# EasyEDA Pro project uno-glue-controller-single-fet-231125_backup-2025-11-30.epro

# Schematic arduino uno 24v shield v5 2025-10-22
Board Name: arduino uno 24v shield v5 2025-10-22; Create Date: 2025-11-23; Page Name: arduino shield v52025-10-22; Project Name: uno glue controller single fet 231125; Schematic Name: arduino uno 24v shield v5 2025-10-22; Update Date: 2025-11-23; Add into BOM: yes; Company: Your Company; Convert to PCB: yes; Date: 2021-08-25; Draw By: אור לב; REV: 1.0; Sheet: 1/1; spicePre: .
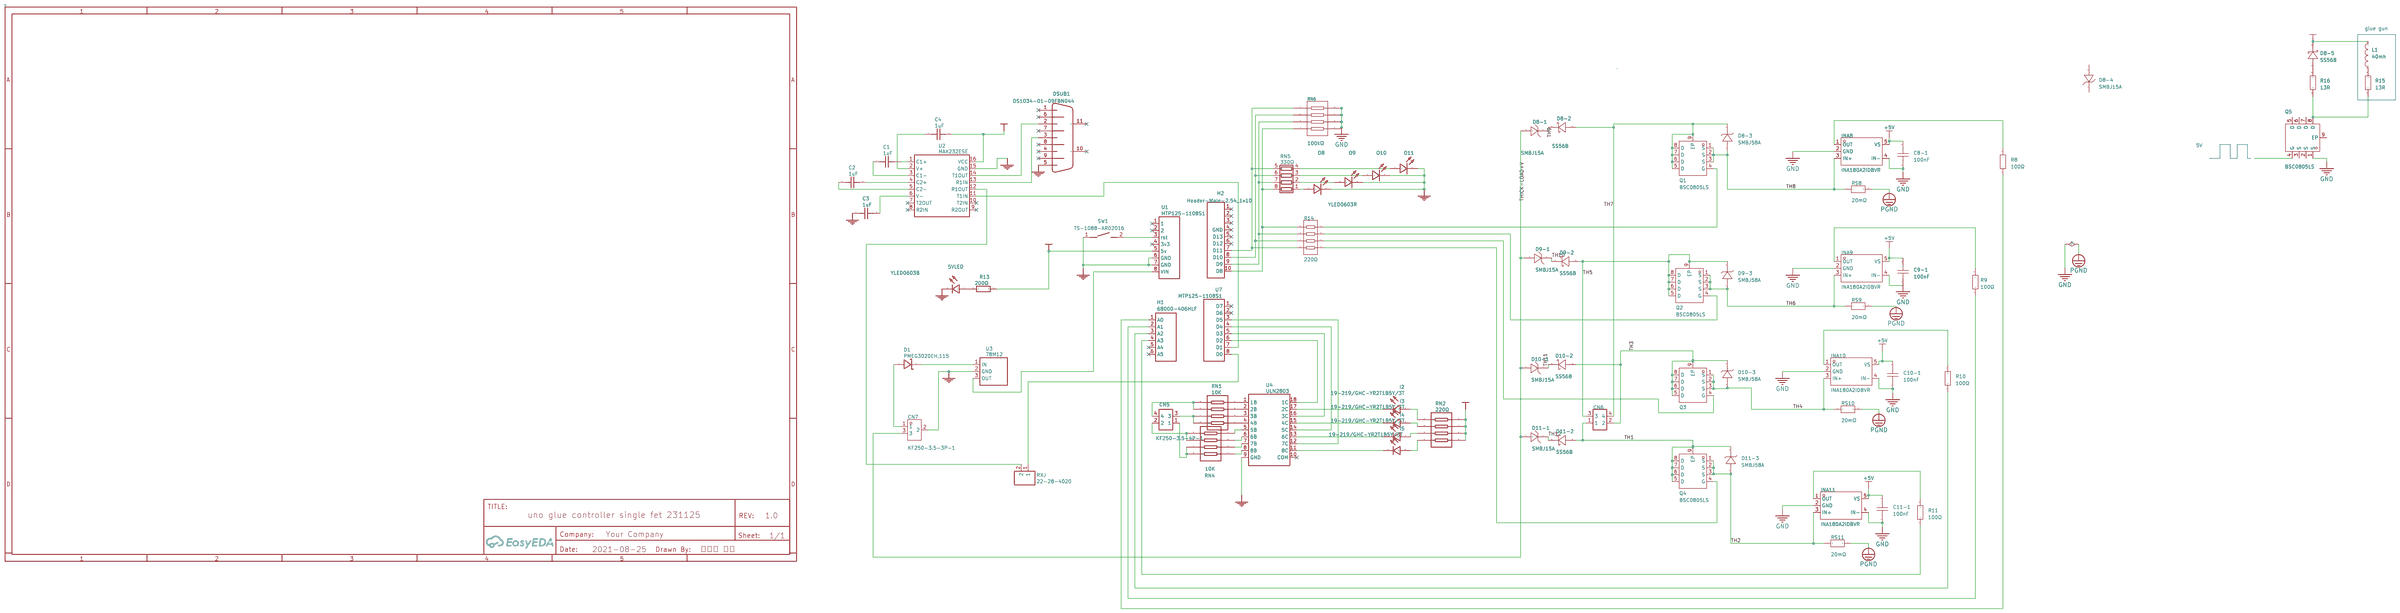
[diagram p0: schematic sheet]

## Parts
5VLED  YLED0603B  [LED0603-FD]
C1  1uF  [C0603]
C2  1uF  [C0603]
C3  1uF  [C0603]
C4  1uF  [C0603]
C8-1  100nF  [C0603]
C9-1  100nF  [C0603]
C10-1  100nF  [C0603]
C11-1  100nF  [C0603]
CN5  KF250-3.5-4P-1  [CONN-TH_4P-P3.50_KF250-3.5-4P-1]
CN6  KF250-3.5-4P-1  [CONN-TH_4P-P3.50_KF250-3.5-4P-1]
CN7  KF250-3.5-3P-1  [CONN-TH_3P-P3.50_KF250-3.5-3P-1]
D1  PMEG3020EH,115  [SOD-123FL_L2.6-W1.6-LS3.4-R-FD]
D8-1  SMBJ15A  [SMB_L4.6-W3.6-LS5.3-RD]
D8-2  SS56B  [SMB_L4.6-W3.7-LS5.4-RD]
D8-3  SMBJ58A  [SMB_L4.6-W3.6-LS5.3-R-RD]
D8-4  SMBJ15A  [SMB_L4.6-W3.6-LS5.3-RD]
D8-5  SS56B  [SMB_L4.6-W3.7-LS5.4-RD]
D9-1  SMBJ15A  [SMB_L4.6-W3.6-LS5.3-RD]
D9-2  SS56B  [SMB_L4.6-W3.7-LS5.4-RD]
D9-3  SMBJ58A  [SMB_L4.6-W3.6-LS5.3-R-RD]
D10-1  SMBJ15A  [SMB_L4.6-W3.6-LS5.3-RD]
D10-2  SS56B  [SMB_L4.6-W3.7-LS5.4-RD]
D10-3  SMBJ58A  [SMB_L4.6-W3.6-LS5.3-R-RD]
D11-1  SMBJ15A  [SMB_L4.6-W3.6-LS5.3-RD]
D11-2  SS56B  [SMB_L4.6-W3.7-LS5.4-RD]
D11-3  SMBJ58A  [SMB_L4.6-W3.6-LS5.3-R-RD]
DSUB1  DS1034-01-09FBN044  [DSUB-TH_DS1034-01-09FBN044]
H1  68000-406HLF  [HDR-TH_6P-P2.54-V-M-1]
H2  Header-Male-2.54_1x10  [HDR-TH_10P-P2.54-V-M-1]
I2  19-219/GHC-YR2T1B5Y/3T  [LED-SMD_L1.6-W0.8_19-219-GHC-YR2T1B5Y-3T]
I3  19-219/GHC-YR2T1B5Y/3T  [LED-SMD_L1.6-W0.8_19-219-GHC-YR2T1B5Y-3T]
I4  19-219/GHC-YR2T1B5Y/3T  [LED-SMD_L1.6-W0.8_19-219-GHC-YR2T1B5Y-3T]
I5  19-219/GHC-YR2T1B5Y/3T  [LED-SMD_L1.6-W0.8_19-219-GHC-YR2T1B5Y-3T]
INA8  INA180A2IDBVR  [SOT-23-5_L3.0-W1.7-P0.95-LS2.8-BL]
INA9  INA180A2IDBVR  [SOT-23-5_L3.0-W1.7-P0.95-LS2.8-BL]
INA10  INA180A2IDBVR  [SOT-23-5_L3.0-W1.7-P0.95-LS2.8-BL]
INA11  INA180A2IDBVR  [SOT-23-5_L3.0-W1.7-P0.95-LS2.8-BL]
L1  40mh  [L0603]
O8  YLED0603R  [LED0603-FD]
O9  YLED0603R  [LED0603-FD]
O10  YLED0603R  [LED0603-FD]
O11  YLED0603R  [LED0603-FD]
Q1  BSC0805LS  [PG-TDSON-8_L5.2-W5.9-P1.27-LS6.2-BL-EP]
Q2  BSC0805LS  [PG-TDSON-8_L5.2-W5.9-P1.27-LS6.2-BL-EP]
Q3  BSC0805LS  [PG-TDSON-8_L5.2-W5.9-P1.27-LS6.2-BL-EP]
Q4  BSC0805LS  [PG-TDSON-8_L5.2-W5.9-P1.27-LS6.2-BL-EP]
Q5  BSC0805LS  [PG-TDSON-8_L5.2-W5.9-P1.27-LS6.2-BL-EP]
R8  100Ω  [R0603]
R9  100Ω  [R0603]
R10  100Ω  [R0603]
R11  100Ω  [R0603]
R13  200Ω  [R0603]
R14  220Ω  [RES-ARRAY-SMD_0402-8P-L2.0-W1.0-BL]
R15  13R  [R0603]
R16  13R  [R0603]
RN1  10K  [RES-ARRAY-SMD_0603-8P-L3.2-W1.6-BL]
RN2  220Ω  [RES-ARRAY-SMD_0603-8P-L3.2-W1.6-BL]
RN4  10K  [RES-ARRAY-SMD_0603-8P-L3.2-W1.6-BL]
RN5  330Ω  [RES-ARRAY-SMD_0402-8P-L2.0-W1.0-BL]
RN6  100kΩ  [RES-ARRAY-SMD_0402-8P-L2.0-W1.0-BL]
RS8  20mΩ  [R1206]
RS9  20mΩ  [R1206]
RS10  20mΩ  [R1206]
RS11  20mΩ  [R1206]
RXJ  22-28-4020  [HDR-TH_2P-P2.54-V-M-1]
SW1  TS-1088-AR02016  [SW-SMD_L4.0-W2.9-LS5.0]
U1  MTP125-1108S1  [HDR-TH_8P-P2.54-H-M]
U2  MAX232ESE  [SOIC-16_L9.9-W3.9-P1.27-LS6.0-BL]
U3  78M12  [TO-252-2_L6.6-W6.1-P4.57-LS9.9-TL-CW]
U4  ULN2803  [SOP-18_L11.4-W7.6-P1.27-LS10.6-BL]
U7  MTP125-1108S1  [HDR-TH_8P-P2.54-H-M]

## Library data of the parts
5VLED = YLED0603B: Emitted Color:Blue Forward Voltage (VF):2.6V~3.2V Forward Voltage (VF):2.6V~3.2V Power Dissipation:- Forward Current:30mA Dominant Wavelength:460nm~475nm Dominant Wavelength:460nm~475nm Peak Wavelength:- Viewing Angle:120° Operating Temperature:-40℃~+85℃; Supplier Part: C19171394; Manufacturer: YONGYUTAI(永裕泰); Supplier Footprint: 0603; JLCPCB Part Class: Extended Part; Datasheet: https://atta.szlcsc.com/upload/public/pdf/source/20231027/6134FF4BA718E32A802654BBC76F69A6.pdf; Supplier: LCSC; Emitted Color: Blue; Forward Voltage (VF): 2.6V~3.2V; Forward Current: 30mA; Dominant Wavelength: 460nm~475nm; Viewing Angle: 120°; Operating Temperature: -40℃~+85℃
C1-C4 = CL10A105KO8NNNC: Capacitance:1uF Tolerance:±10% Tolerance:±10% Voltage Rating:16V Temperature Coefficient:X5R; LCSC Part Name: 1uF ±10% 16V; Supplier Part: C1592; Manufacturer: SAMSUNG(三星); Supplier Footprint: 0603; JLCPCB Part Class: Extended Part; Datasheet: https://item.szlcsc.com/datasheet/CL10A105KO8NNNC/1944.html; Supplier: LCSC; Tolerance: ±10%; Voltage Rating: 16V; Temperature Coefficient: X5R
C8-1 C9-1 C10-1 C11-1 = CC0603KRX7R9BB104: Capacitance:100nF Tolerance:±10% Tolerance:±10% Voltage Rating:50V Temperature Coefficient:X7R; LCSC Part Name: 100nF ±10% 50V; Supplier Part: C14663; Manufacturer: YAGEO(国巨); Supplier Footprint: 0603; JLCPCB Part Class: Basic Part; Datasheet: https://item.szlcsc.com/datasheet/CC0603KRX7R9BB104/15331.html; Supplier: LCSC; Tolerance: ±10%; Voltage Rating: 50V; Temperature Coefficient: X7R
CN5 CN6 = KF250-3.5-4P-1: Pitch:3.5mm Mounting Type:- Number of Pins:4P Number of PINs Per Row:4 Current Rating:5A Voltage Rating (Max):400V Wire Gauge - AWG:18~22 Wire Gauge - mm2:0.75; LCSC Part Name: 3.5mm 每排P数:4; Supplier Part: C475156; Manufacturer: KEFA(科发); Supplier Footprint: 插件,P=3.5mm; JLCPCB Part Class: Extended Part; Datasheet: https://item.szlcsc.com/datasheet/KF250-3.5-4P-1/481652.html; Supplier: LCSC; Pitch: 3.5mm; Number of Pins: 4P; Number of PINs Per Row: 4; Current Rating: 5A; Voltage Rating (Max): 400V; Wire Gauge - AWG: 18~22; Wire Gauge - mm2: 0.75
CN7 = KF250-3.5-3P-1: Pitch:3.5mm Mounting Type:- Number of Pins:3P Number of PINs Per Row:3 Current Rating:5A Voltage Rating (Max):400V Wire Gauge - AWG:18~22 Wire Gauge - mm2:0.75; LCSC Part Name: 3.5mm 每排P数:3; Supplier Part: C475155; Manufacturer: KEFA(科发); Supplier Footprint: 插件,P=3.5mm; JLCPCB Part Class: Extended Part; Datasheet: https://item.szlcsc.com/datasheet/KF250-3.5-3P-1/481651.html; Supplier: LCSC; Pitch: 3.5mm; Number of Pins: 3P; Number of PINs Per Row: 3; Current Rating: 5A; Voltage Rating (Max): 400V; Wire Gauge - AWG: 18~22; Wire Gauge - mm2: 0.75
D1 = PMEG3020EH,115: Supplier: LCSC; Supplier Part: C167645; Manufacturer: Nexperia; JLCPCB Part Class: Extended Part; Contributor: LCSC; spicePre: D
D8-1 D8-4 D9-1 D10-1 D11-1 = SMBJ15A_C908796: Polarity:Unidirectional Reverse Stand-Off Voltage (Vrwm):15V Clamping Voltage:24.4V Peak Pulse Current (Ipp):24A Peak Pulse Power Dissipation (Ppp):600W Voltage - Breakdown:16.7V Reverse Leakage Current (Ir):5uA Operating Temperature:-55℃~+150℃@(Tj) Opera; LCSC Part Name: 单向TVS 15V截止 24A峰值脉冲; Supplier Part: C908796; Manufacturer: GOODWORK(固得沃克); Supplier Footprint: DO-214AA(SMB); JLCPCB Part Class: Extended Part; Datasheet: https://item.szlcsc.com/datasheet/SMBJ15A/975548.html; Supplier: LCSC; Polarity: Unidirectional; Reverse Stand-Off Voltage (Vrwm): 15V; Clamping Voltage: 24.4V; Peak Pulse Current (Ipp): 24A; Peak Pulse Power Dissipation (Ppp): 600W; Voltage - Breakdown: 16.7V; Reverse Leakage Current (Ir): 5uA; Operating Temperature: -55℃~+150℃@(Tj); Type: TVS
D8-2 D8-5 D9-2 D10-2 D11-2 = SS56B_C5343335: Diode Configuration:Independent Voltage - Forward(Vf@If):700mV@5A Voltage - DC Reverse(Vr):60V Current - Rectified:5A; LCSC Part Name: 电压:60V 电流:5A; Supplier Part: C5343335; Manufacturer: MSKSEMI(美森科); Supplier Footprint: SMB; JLCPCB Part Class: Extended Part; Datasheet: https://item.szlcsc.com/datasheet/SS56B/6120058.html; Supplier: LCSC; Diode Configuration: Independent; Voltage - Forward(Vf@If): 700mV@5A; Voltage - DC Reverse(Vr): 60V; Current - Rectified: 5A
D8-3 D9-3 D10-3 D11-3 = SMBJ58A_C41376102: Polarity:Unidirectional Reverse Stand-Off Voltage (Vrwm):58V Clamping Voltage:93.6V Peak Pulse Current (Ipp):6.41A Peak Pulse Power Dissipation (Ppp):600W Voltage - Breakdown:71.2V Reverse Leakage Current (Ir):5uA Number of Channels:1.0 Operating Temperat; LCSC Part Name: 单向TVS 58V截止 峰值浪涌电流：6.41A; Supplier Part: C41376102; Manufacturer: R+O(宏嘉诚); Supplier Footprint: DO-214AA(SMB); JLCPCB Part Class: Extended Part; Datasheet: https://item.szlcsc.com/datasheet/SMBJ58A/43144819.html; Supplier: LCSC; Polarity: Unidirectional; Reverse Stand-Off Voltage (Vrwm): 58V; Clamping Voltage: 93.6V; Peak Pulse Current (Ipp): 6.41A; Peak Pulse Power Dissipation (Ppp): 600W; Voltage - Breakdown: 71.2V; Reverse Leakage Current (Ir): 5uA; Number of Channels: 1.0; Operating Temperature: -55℃~+150℃; level of protection: IEC 61000-4-2; Type: TVS
DSUB1 = -: Supplier: LCSC; Supplier Part: C86572; Manufacturer: CONNFLY Elec; JLCPCB Part Class: Extended Part; Contributor: LCSC; spicePre: D
H1 = 68000-406HLF: Supplier: LCSC; Supplier Part: C178289; Manufacturer: Amphenol ICC; JLCPCB Part Class: Extended Part; Contributor: LCSC; spicePre: H
H2 = Headers  Pins2.54mm1*10P: Supplier: LCSC; Supplier Part: C57369; JLCPCB Part Class: Extended Part; spicePre: H; Package Display: No
I2-I5 = 19-219/GHC-YR2T1B5Y/3T: Lamp Holder Type:- Illumination Color:Green Voltage - Forward(Vf):- Voltage - Forward(Vf):- Power(Watts):- Forward Current:- Wavelength - Dominant:518nm Wavelength - Dominant:518nm Peak Wavelength:525nm Diode Configuration:- Lens Color:Water Clear Color T; LCSC Part Name: 0603正贴式 绿灯(Iv=140~360mcd) @IF=20mA); Supplier Part: C2994781; Manufacturer: EVERLIGHT(亿光); Supplier Footprint: 0603; JLCPCB Part Class: Extended Part; Datasheet: https://www.everlighteurope.com/custom/files/datasheets/DSE-0006814.pdf; Supplier: LCSC; Illumination Color: Green; Wavelength - Dominant: 518nm; Peak Wavelength: 525nm; Lens Color: Water Clear
INA8-INA11 = INA180A2IDBVR: Number of Channels:1 Vcm - Common Mode Voltage:-200mV~26V Vcm - Common Mode Voltage:-200mV~26V Gain:50V/V Bandwidth:210kHz Ib - Input Bias Current:100nA Vos - Input Offset Voltage:25uV Operating Temperature:-40℃~+125℃ Operating Temperature:-40℃~+125℃ Diff; Supplier Part: C192764; Manufacturer: TI(德州仪器); Supplier Footprint: SOT-23-5; JLCPCB Part Class: Extended Part; Datasheet: https://www.ti.com/cn/lit/gpn/ina180; Supplier: LCSC; Number of Channels: 1; Vcm - Common Mode Voltage: -200mV~26V; Gain: 50V/V; Bandwidth: 210kHz; Ib - Input Bias Current: 100nA; Vos - Input Offset Voltage: 25uV; Operating Temperature: -40℃~+125℃; Differential Voltage: -26V~+26V; Single Supply: 2.7V~5.5V; Quiescent Current: 197uA; Output Current: 8mA; Input Offset Voltage Drift(Vos TC): 1uV/℃; Input Offset Current(Ios): 50nA; Slew Rate: 2V/us; Common Mode Rejection Ratio (CMRR): 100dB; Noise density(eN): 40nV/√Hz
L1 = L_0603
O8-O11 = YLED0603R: Emitted Color:Red Forward Voltage (VF):1.8V~2.4V Forward Voltage (VF):1.8V~2.4V Power Dissipation:- Forward Current:25mA Dominant Wavelength:620nm~625nm Dominant Wavelength:620nm~625nm Peak Wavelength:- Diode Configuration:- Lens Color:- Color Temperature; Supplier Part: C19171390; Manufacturer: YONGYUTAI(永裕泰); Supplier Footprint: 0603; JLCPCB Part Class: Extended Part; Datasheet: https://atta.szlcsc.com/upload/public/pdf/source/20231027/FB19AF06E2C70028E58AB5CEDD1BDC72.pdf; Supplier: LCSC; Emitted Color: Red; Forward Voltage (VF): 1.8V~2.4V; Forward Current: 25mA; Dominant Wavelength: 620nm~625nm; Operating Temperature: -40℃~+85℃
Q1-Q5 = BSC0805LS: Number:1 N-Channel Drain to Source Voltage:100V Current - Continuous Drain(Id):61A RDS(on):- Pd - Power Dissipation:2.5W Gate Threshold Voltage (Vgs(th)):2.3V Gate Charge(Qg):16nC Input Capacitance(Ciss):2.7nF@50V Reverse Transfer Capacitance (Crss@Vds):2; LCSC Part Name: 1个N沟道 耐压:100V 电流:61A; Supplier Part: C534374; Manufacturer: Infineon(英飞凌); Supplier Footprint: TDSON-8(5x6); JLCPCB Part Class: Extended Part; Datasheet: https://item.szlcsc.com/datasheet/BSC0805LS/554758.html; Supplier: LCSC; Number: 1 N-Channel; Drain to Source Voltage: 100V; Current - Continuous Drain(Id): 61A; Pd - Power Dissipation: 2.5W; Gate Threshold Voltage (Vgs(th)): 2.3V; Gate Charge(Qg): 16nC; Input Capacitance(Ciss): 2.7nF@50V; Reverse Transfer Capacitance (Crss@Vds): 28pF@50V; Operating Temperature: -55℃~+150℃
R8-R11 = RC0603FR-07100RL: Type:Thick Film Resistors Resistance: Tolerance:±1% Tolerance:±1% Power(Watts): Overload Voltage (Max): Temperature Coefficient:±100ppm/℃ Temperature Coefficient:±100ppm/℃ Operating Temperature Range:-55℃~+155℃ Operating Temperature Range:-55℃~+155℃; LCSC Part Name: 厚膜电阻 100Ω ±1% 100mW; Supplier Part: C105588; Manufacturer: YAGEO(国巨); Supplier Footprint: 0603; JLCPCB Part Class: Extended Part; Datasheet: https://atta.szlcsc.com/upload/public/pdf/source/20180316/70C0E2BDAE7FCC62C531A5A58D202EE1.pdf; Supplier: LCSC; Type: Thick Film Resistors; Tolerance: ±1%; Temperature Coefficient: ±100ppm/℃; Operating Temperature Range: -55℃~+155℃
R13 = 0603WAF2000T5E: Type:Thick Film Resistor Resistance:200Ω Tolerance:±1% Tolerance:±1% Power(Watts):100mW Voltage-Supply(Max):75V Temperature Coefficient:±100ppm/℃ Temperature Coefficient:±100ppm/℃ Operating Temperature:-55℃~+155℃ Operating Temperature:-55℃~+155℃; LCSC Part Name: 200Ω ±1% 100mW 厚膜电阻; Supplier Part: C8218; Manufacturer: UNI-ROYAL(厚声); Supplier Footprint: 0603; JLCPCB Part Class: Basic Part; Datasheet: https://item.szlcsc.com/datasheet/0603WAF2000T5E/8708.html; Supplier: LCSC; Type: Thick Film Resistor; Tolerance: ±1%; Power(Watts): 100mW; Voltage-Supply(Max): 75V; Temperature Coefficient: ±100ppm/℃; Operating Temperature: -55℃~+155℃
R14 = YC124-FR-07220RL: Number of Resistors: Resistance:220Ω Tolerance:±1% Tolerance:±1% Power(Watts):62.5mW Temperature Coefficient:±200ppm/℃ Temperature Coefficient:±200ppm/℃ Number of Pins:; LCSC Part Name: 220Ω ±1%; Supplier Part: C728719; Manufacturer: YAGEO(国巨); Supplier Footprint: 0402x4; JLCPCB Part Class: Extended Part; Datasheet: https://item.szlcsc.com/datasheet/YC124-FR-07220RL/776034.html; Supplier: LCSC; Tolerance: ±1%; Power(Watts): 62.5mW; Temperature Coefficient: ±200ppm/℃
R15 R16 = Res_0603: Supplier Footprint: 0603
RN1 RN4 = YC164-JR-0710KL: Supplier: LCSC; Manufacturer: YAGEO; Supplier Part: C107374; JLCPCB Part Class: Extended Part; nameAlias: Resistance (Ohms); spicePre: R
RN2 = 4D03WGJ0221T5E: Number of Resistors: Resistance:220Ω Tolerance:±5% Tolerance:±5% Power(Watts):62.5mW Temperature Coefficient:±200ppm/℃ Temperature Coefficient:±200ppm/℃ Number of Pins:; LCSC Part Name: 220Ω ±5%; Supplier Part: C29719; Manufacturer: UNI-ROYAL(厚声); Supplier Footprint: 0603x4; JLCPCB Part Class: Extended Part; Datasheet: https://item.szlcsc.com/datasheet/4D03WGJ0221T5E/30473.html; Supplier: LCSC; Tolerance: ±5%; Power(Watts): 62.5mW; Temperature Coefficient: ±200ppm/℃
RN5 = WA04X331JTL: Number of Resistors: Resistance: Tolerance:±5% Tolerance:±5% Power(Watts): Temperature Coefficient:±200ppm/℃ Temperature Coefficient:±200ppm/℃ Number of Pins:; LCSC Part Name: 330Ω ±5%; Supplier Part: C170189; Manufacturer: Walsin(华新科); Supplier Footprint: 0402x4; JLCPCB Part Class: Extended Part; Datasheet: https://atta.szlcsc.com/upload/public/pdf/source/20191217/C470039_CC7AFF3B041022450689C8A1C71009D6.pdf; Supplier: LCSC; Tolerance: ±5%; Temperature Coefficient: ±200ppm/℃
RN6 = 4D02WGJ0104TCE: Number of Resistors: Resistance:100kΩ Tolerance:±5% Tolerance:±5% Power(Watts):62.5mW Temperature Coefficient:±200ppm/℃ Temperature Coefficient:±200ppm/℃ Number of Pins:; LCSC Part Name: 100kΩ ±5%; Supplier Part: p; Manufacturer: UNI-ROYAL(厚声); Supplier Footprint: 0402x4; JLCPCB Part Class: Extended Part; Datasheet: https://item.szlcsc.com/datasheet/4D02WGJ0104TCE/26467.html; Supplier: LCSC; Tolerance: ±5%; Power(Watts): 62.5mW; Temperature Coefficient: ±200ppm/℃
RS8-RS11 = FRM121WFR020TM: Type:Current Sense Resistor Resistance:20mΩ Tolerance:±1% Tolerance:±1% Power(Watts):1W Temperature Coefficient:±50ppm/℃ Temperature Coefficient:±50ppm/℃; LCSC Part Name: 20mΩ ±1% 1W 合金电阻; Supplier Part: C7420010; Manufacturer: FOJAN(富捷); Supplier Footprint: 1206; JLCPCB Part Class: Extended Part; Datasheet: https://item.szlcsc.com/datasheet/FRM121WFR020TM/8395303.html; Supplier: LCSC; Type: Current Sense Resistor; Tolerance: ±1%; Power(Watts): 1W; Temperature Coefficient: ±50ppm/℃
RXJ = 22-28-4020: Supplier: LCSC; Supplier Part: C234182; Manufacturer: MOLEX; JLCPCB Part Class: Extended Part; Contributor: LCSC; spicePre: C
SW1 = TS-1088-AR02016: Supplier: LCSC; Supplier Part: C720477; Manufacturer: XUNPU; JLCPCB Part Class: Extended Part; Contributor: LCSC; spicePre: S
U1 U7 = MTP125-1108S1: Supplier: LCSC; Supplier Part: C358689; Manufacturer: MINTRON; JLCPCB Part Class: Extended Part; Contributor: LCSC; spicePre: U
U2 = MAX232ESE: Supplier: LCSC; Manufacturer: MAXIM; Supplier Part: C26860; JLCPCB Part Class: Basic Part; Contributor: LCSC; spicePre: U
U3 = 78M12: Supplier: LCSC; Manufacturer: SK; Supplier Part: C116325; JLCPCB Part Class: Extended Part; Contributor: LCSC; spicePre: U
U4 = ULN2803_C2690548: number of channels:8 Collector - Emitter Voltage VCEO:50V Voltage - Input(Max):30V Operating Temperature:-30℃~+105℃ Operating Temperature:-30℃~+105℃; Supplier Part: C2690548; Manufacturer: BL(上海贝岭); Supplier Footprint: SOP-18-300mil; JLCPCB Part Class: Extended Part; Datasheet: https://item.szlcsc.com/datasheet/ULN2803/2799941.html; Supplier: LCSC; number of channels: 8; Collector - Emitter Voltage VCEO: 50V; Voltage - Input(Max): 30V; Operating Temperature: -30℃~+105℃

## Nets
+5V: C4.2 C8-1.2 C9-1.2 C10-1.2 C11-1.2 INA8.5(VS) INA9.5(VS) INA10.5(VS) INA11.5(VS) R13.2 RN2.5 RN2.6 RN2.7 RN2.8 U1.5(5v) U2.16(VCC)
+48V: D8-5.1(K) L1.2
GND: 5VLED.2(C) C3.1 C8-1.1 C10-1.1 C11-1.1 CN7.2 DSUB1.5 INA8.2(GND) INA8.4(IN-) INA9.2(GND) INA10.2(GND) INA10.4(IN-) INA11.2(GND) INA11.4(IN-) O8.2(C) O9.2(C) O10.2(C) O11.2(C) Q5.1(S) RN6.5 RN6.6 RN6.7 RN6.8 RS8.2 RS9.2 RS10.2 RS11.2 SW1.1 U1.6(GND) U1.7(GND) U2.15(GND) U3.2(GND) U4.9(GND)
TH1: CN6.1 D11-2.2(A) D11-3.2(C) Q4.5(D) Q4.6(D) Q4.7(D) Q4.8(D) Q4.9(EP)
TH2: D11-3.1(A) INA11.3(IN+) Q4.1(S) Q4.2(S) Q4.3(S) RS11.1
TH3: CN6.2 D10-2.2(A) D10-3.2(C) Q3.5(D) Q3.6(D) Q3.7(D) Q3.8(D) Q3.9(EP)
TH4: D10-3.1(A) INA10.3(IN+) Q3.1(S) Q3.2(S) Q3.3(S) RS10.1
TH5: CN6.3 D9-2.2(A) D9-3.2(C) Q2.5(D) Q2.6(D) Q2.7(D) Q2.8(D) Q2.9(EP)
TH6: D9-3.1(A) INA9.3(IN+) Q2.1(S) Q2.2(S) Q2.3(S) RS9.1
TH7: CN6.4 D8-2.2(A) D8-3.2(C) Q1.5(D) Q1.6(D) Q1.7(D) Q1.8(D) Q1.9(EP)
TH8: D8-3.1(A) INA8.3(IN+) Q1.1(S) Q1.2(S) Q1.3(S) RS8.1
TH9: D8-1.1(C) D8-2.1(K)
TH10: D9-1.1(C) D9-2.1(K)
TH11: D10-1.1(C) D10-2.1(K)
TH12: D11-1.1(C) D11-2.1(K)
THICK-LOAD+V: CN7.3 D8-1.2(A) D9-1.2(A) D10-1.2(A) D11-1.2(A)
$1N5: D1.1(C) U3.1(IN)
$1N6: U2.11(T1IN) U7.7(D1)
$1N7: C1.1 U2.3(C1-)
$1N8: C2.1 U2.5(C2-)
$1N10: C3.2 U2.6(V-)
$1N11: DSUB1.3 U2.13(R1IN)
$1N12: DSUB1.2 U2.14(T1OUT)
$1N13: C2.2 U2.4(C2+)
$1N14: C4.1 U2.2(V+)
$1N19: SW1.2 U1.3(rst)
$1N20: U1.8(VIN) U3.3(OUT)
$1N21: C1.2 U2.1(C1+)
$1N25: CN7.1 D1.2(A)
$1N26: U4.18(1C) U7.6(D2)
$1N27: U4.16(3C) U7.5(D3)
$1N28: U4.14(5C) U7.4(D4)
$1N29: U4.12(7C) U7.3(D5)
$1N30: I2.2(C) U4.17(2C)
$1N31: I3.2(C) U4.15(4C)
$1N32: I4.2(C) U4.13(6C)
$1N33: I5.2(C) U4.11(8C)
$1N49: CN5.3 RN1.7 RN1.8
$1N50: CN5.2 RN4.5 RN4.6
$1N51: CN5.1 RN4.7 RN4.8
$1N52: RN4.1 U4.8(8B)
$1N53: RN4.2 U4.7(7B)
$1N54: RN4.3 U4.6(6B)
$1N55: RN4.4 U4.5(5B)
$1N56: RXJ.2 U2.12(R1OUT)
$1N57: RXJ.1 U7.8(D0)
$1N596: 5VLED.1(A) R13.1
$1N599: RN1.4 U4.1(1B)
$1N600: RN1.3 U4.2(2B)
$1N601: RN1.2 U4.3(3B)
$1N602: RN1.1 U4.4(4B)
$1N2481: O8.1(A) RN5.1(R1.1)
$1N2485: O9.1(A) RN5.2(R2.1)
$1N2489: O10.1(A) RN5.3(R3.1)
$1N2499: O11.1(A) RN5.4(R4.1)
$1N4108: CN5.4 RN1.5 RN1.6
$1N8074: I2.1(A) RN2.1
$1N8085: I3.1(A) RN2.2
$1N8105: I4.1(A) RN2.3
$1N8110: I5.1(A) RN2.4
$1N10348: H1.1(A0) R8.1
$1N10353: INA8.1(OUT) R8.2
$1N10722: INA9.1(OUT) R9.2
$1N10973: INA10.1(OUT) R10.2
$1N11224: INA11.1(OUT) R11.2
$1N16140: C9-1.1 INA9.4(IN-)
$1N19766: H1.4(A3) R11.1
$1N19775: H1.3(A2) R10.1
$1N19778: H1.2(A1) R9.1
$1N19892: Q3.4(G) R14.2
$1N19926: H2.7(D11) R14.8 RN5.5(R4.2) RN6.1
$1N19936: H2.9(D9) R14.6 RN5.7(R2.2) RN6.3
$1N19946: H2.8(D10) R14.7 RN5.6(R3.2) RN6.2
$1N19956: H2.10(D8) R14.5 RN5.8(R1.2) RN6.4
$1N20048: Q1.4(G) R14.4
$1N20053: Q2.4(G) R14.3
$1N20058: Q4.4(G) R14.1
Net-(D8-5-2): D8-5.2(A) R16.2
Net-(L1-1): L1.1 R15.2
Net-(Q5-8): Q5.8(D) R15.1 R16.1

Not connected (* = marked no-connect by the designer): D8-4 1(C) 2(A); DSUB1 1* 4* 6* 7* 8* 9* 10(MH1)* 11(MH2)*; H1 5(A4)* 6(A5)*; H2 1* 2* 3* 4(GND)* 5(D13)* 6(D12)*; Q5 2(S) 3(S) 4(G) 5(D) 6(D) 7(D) 9(EP); U1 1* 2* 4(3v3)*; U2 7(T2OUT)* 8(R2IN)* 9(R2OUT)* 10(T2IN)*; U4 10(COM)*; U7 1(D7)* 2(D6)*

## Notes on the sheet
- glue gun
- 5V

# Board PCB 2025-10-22
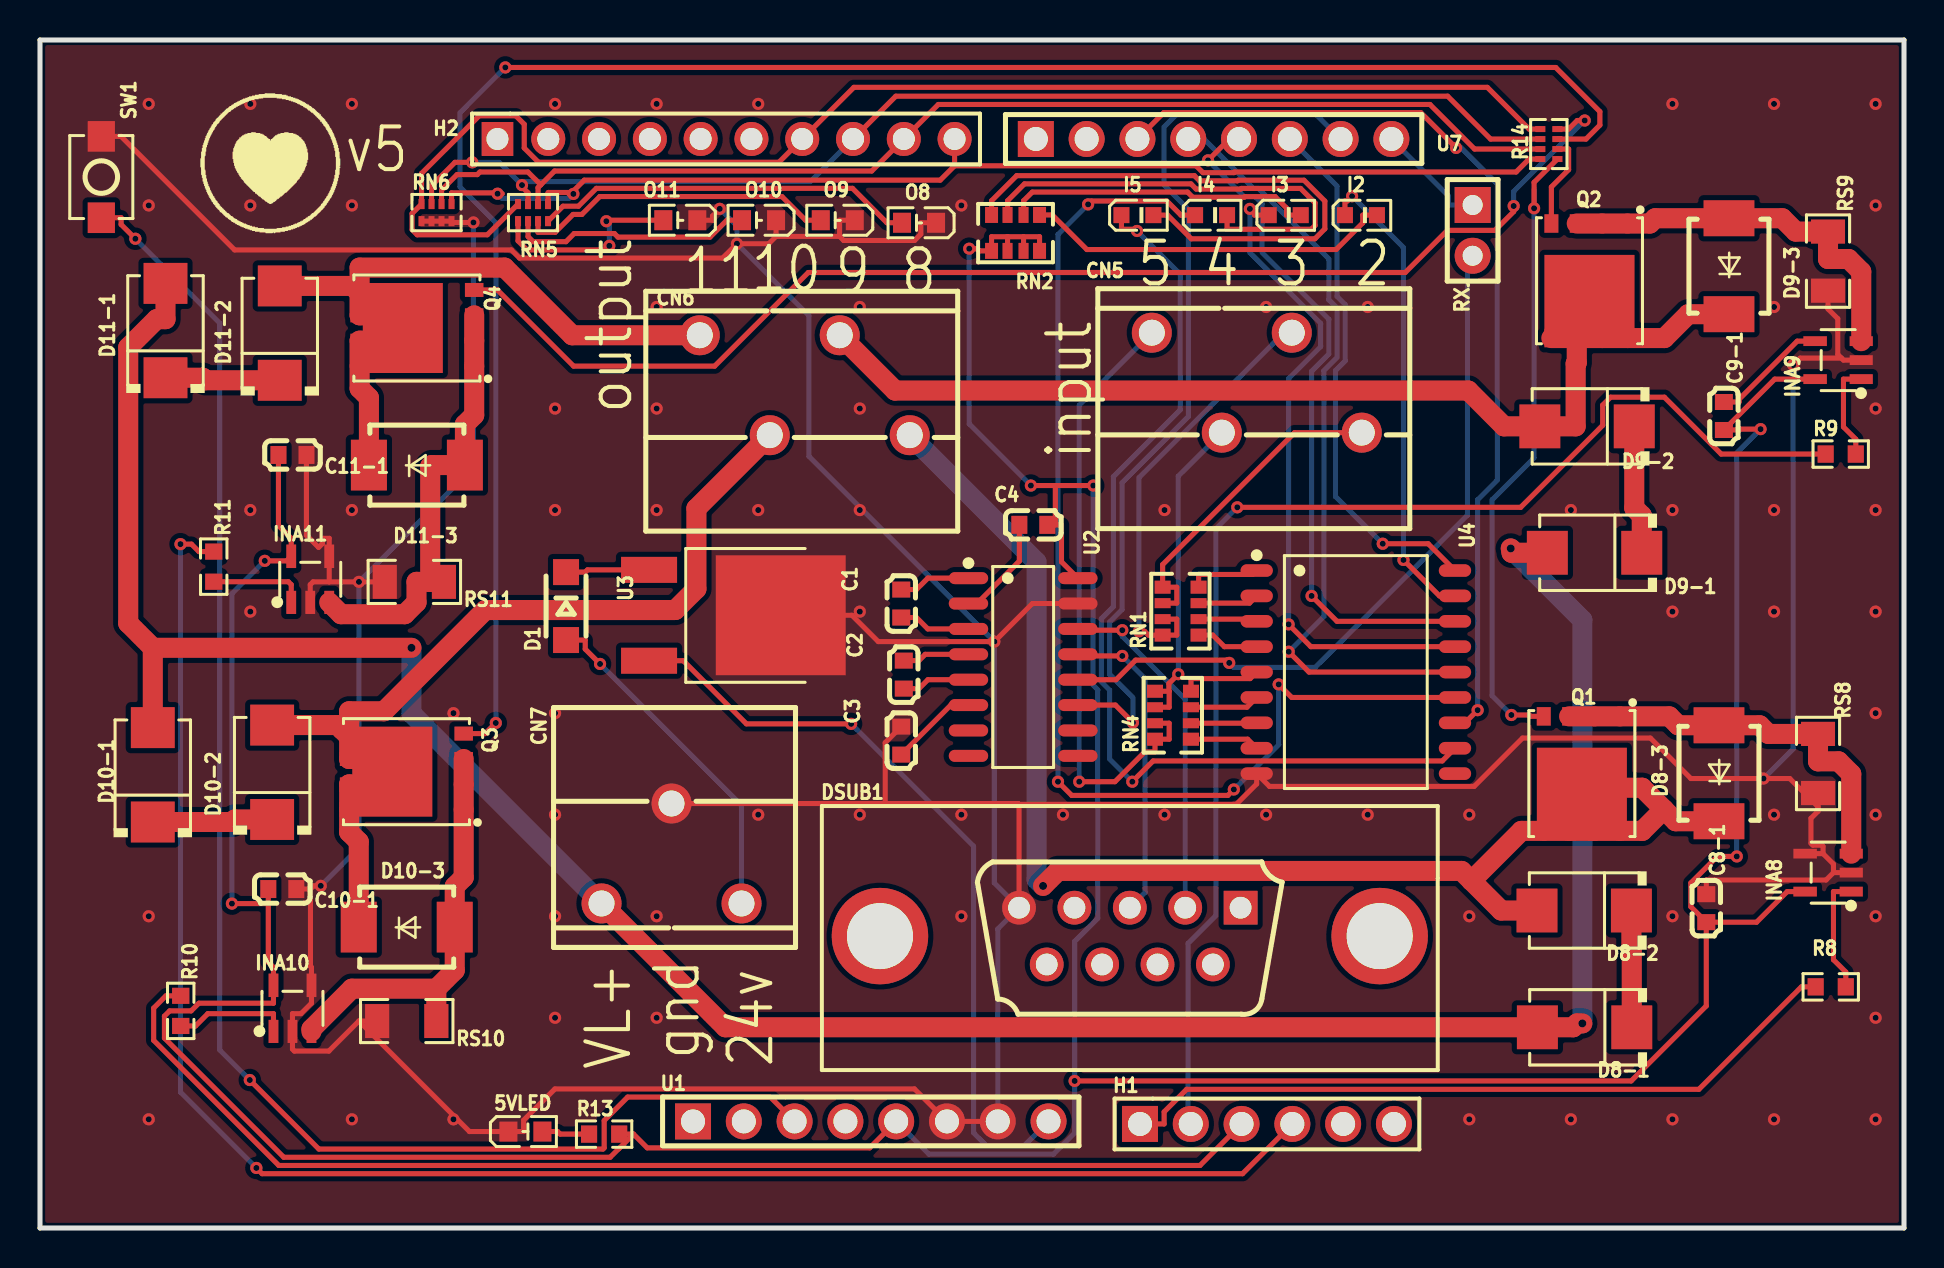
[diagram p1: board, top side]
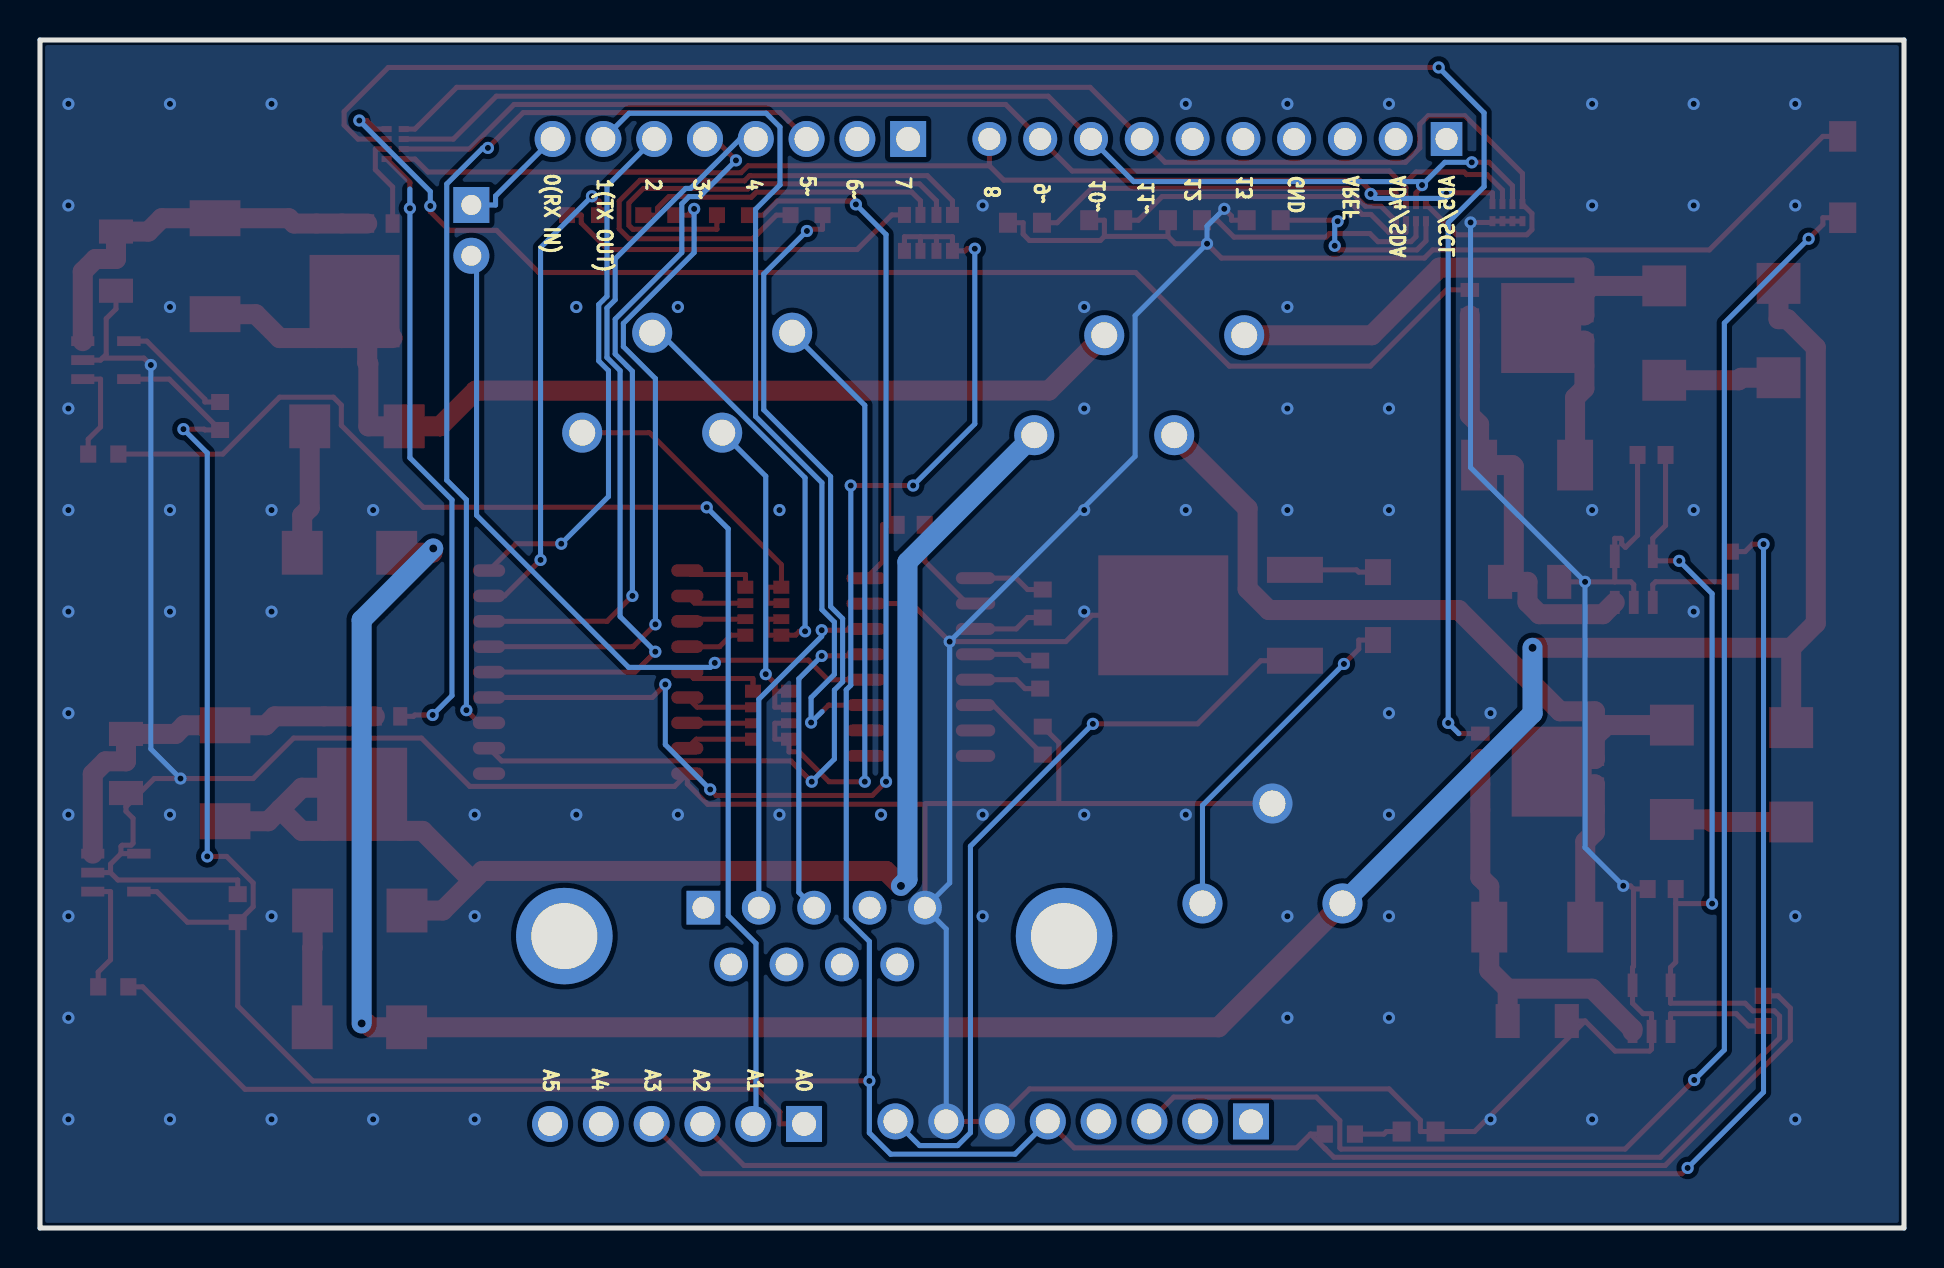
[diagram p2: board, bottom side, seen from below]

Outline 93.22 x 59.44 mm; copper layers: Top Layer, Bottom Layer. Coordinates in mm from the lower left corner of the outline.
Outline path: 0,59.44 93.22,59.44 93.22,0 0,0 0,59.44
Stack: Top Layer 0.035mm / Dielectric1 1.51mm FR4 er 4.5 / Bottom Layer 0.035mm

## Design rules (mm)
net TH6: powerLine
net TH1: powerLine
net TH5: powerLine
net TH7: powerLine
net TH8: powerLine
net TH4: powerLine
net TH2: powerLine
net TH10: powerLine
net TH11: powerLine
net TH12: powerLine
net TH9: powerLine
net THICK-LOAD+V: powerLine
net TH3: powerLine
template: Custom Config
spacing copperThickness1oz (default): track to track 0.102, other pairs 0.152 to 0.3
spacing copperThickness2oz: track to track 0.203, other pairs 0.152 to 0.3
track width copperThickness1oz (default): min 0.127, default 0.254, max 2.54
track width copperThickness2oz: min 0.8, default 1, max 2
track width power: min 1, default 1, max 1
differential pair differentialPair (default): width min 0.127, default 0.254, max 2.54; gap min 0.152, default 0.152
via viaSize (default): diameter min 0.5, default 0.61, max 10; hole min 0.3, default 0.305, max 6.3
via viaPowerSize: diameter min 0.5, default 0.9, max 10; hole min 0.3, default 0.4, max 6.3
net class powerLine uses power, viaPowerSize
net TH6 uses power, viaPowerSize
net TH1 uses power, viaPowerSize
net TH5 uses power, viaPowerSize
net TH7 uses power, viaPowerSize
net TH8 uses power, viaPowerSize
net TH4 uses power, viaPowerSize
net TH2 uses power, viaPowerSize
net TH10 uses power, viaPowerSize
net TH11 uses power, viaPowerSize
net TH12 uses power, viaPowerSize
net TH9 uses power, viaPowerSize
net THICK-LOAD+V uses power, viaPowerSize
net TH3 uses power, viaPowerSize

## Placement (name value [footprint] x y rotation side)
5VLED  YLED0603B  [LED0603-FD]  24.28 4.83 180 top
C1  1uF  [C0603]  43.07 31.24 90 top
C2  1uF  [C0603]  43.2 27.69 90 top
C3  1uF  [C0603]  43.07 24.38 270 top
C4  1uF  [C0603]  49.68 35.18 0 top
C8-1  100nF  [C0603]  83.33 16 270 top
C9-1  100nF  [C0603]  84.21 40.63 270 top
C10-1  100nF  [C0603]  12.12 16.96 180 top
C11-1  100nF  [C0603]  12.63 38.68 180 top
CN5  KF250-3.5-4P-1  [CONN-TH_4P-P3.50_KF250-3.5-4P-1]  60.85 42.29 0 top
CN6  KF250-3.5-4P-1  [CONN-TH_4P-P3.50_KF250-3.5-4P-1]  38.25 42.16 0 top
CN7  KF250-3.5-3P-1  [CONN-TH_3P-P3.50_KF250-3.5-3P-1]  31.58 18.74 180 top
D1  PMEG3020EH,115  [SOD-123FL_L2.6-W1.6-LS3.4-R-FD]  26.31 31.12 90 top
D8-1  SMBJ15A  [SMB_L4.6-W3.6-LS5.3-RD]  77.24 10.04 180 top
D8-2  SS56B  [SMB_L4.6-W3.7-LS5.4-RD]  77.23 15.88 180 top
D8-3  SMBJ58A  [SMB_L4.6-W3.6-LS5.3-R-RD]  83.97 22.75 90 top
D9-1  SMBJ15A  [SMB_L4.6-W3.6-LS5.3-RD]  77.74 33.78 180 top
D9-2  SS56B  [SMB_L4.6-W3.7-LS5.4-RD]  77.37 40.11 180 top
D9-3  SMBJ58A  [SMB_L4.6-W3.6-LS5.3-R-RD]  84.47 48.12 90 top
D10-1  SMBJ15A  [SMB_L4.6-W3.6-LS5.3-RD]  5.64 22.67 90 top
D10-2  SS56B  [SMB_L4.6-W3.7-LS5.4-RD]  11.61 22.8 90 top
D10-3  SMBJ58A  [SMB_L4.6-W3.6-LS5.3-R-RD]  18.34 15.05 0 top
D11-1  SMBJ15A  [SMB_L4.6-W3.6-LS5.3-RD]  6.28 44.9 90 top
D11-2  SS56B  [SMB_L4.6-W3.7-LS5.4-RD]  11.99 44.77 90 top
D11-3  SMBJ58A  [SMB_L4.6-W3.6-LS5.3-R-RD]  18.85 38.17 0 top
DSUB1  DS1034-01-09FBN044  [DSUB-TH_DS1034-01-09FBN044]  54.5 14.61 0 top
H1  68000-406HLF  [HDR-TH_6P-P2.54-V-M-1]  61.36 5.21 0 top
H2  Header-Male-2.54_1x10  [HDR-TH_10P-P2.54-V-M-1]  34.31 54.48 0 top
I2  19-219/GHC-YR2T1B5Y/3T  [LED-SMD_L1.6-W0.8_19-219-GHC-YR2T1B5Y-3T]  66.06 50.67 0 top
I3  19-219/GHC-YR2T1B5Y/3T  [LED-SMD_L1.6-W0.8_19-219-GHC-YR2T1B5Y-3T]  62.25 50.67 0 top
I4  19-219/GHC-YR2T1B5Y/3T  [LED-SMD_L1.6-W0.8_19-219-GHC-YR2T1B5Y-3T]  58.57 50.67 0 top
I5  19-219/GHC-YR2T1B5Y/3T  [LED-SMD_L1.6-W0.8_19-219-GHC-YR2T1B5Y-3T]  54.88 50.67 0 top
INA8  INA180A2IDBVR  [SOT-23-5_L3.0-W1.7-P0.95-LS2.8-BL]  89.43 17.78 90 top
INA9  INA180A2IDBVR  [SOT-23-5_L3.0-W1.7-P0.95-LS2.8-BL]  89.93 43.42 90 top
INA10  INA180A2IDBVR  [SOT-23-5_L3.0-W1.7-P0.95-LS2.8-BL]  12.63 10.99 0 top
INA11  INA180A2IDBVR  [SOT-23-5_L3.0-W1.7-P0.95-LS2.8-BL]  13.52 32.45 0 top
O8  YLED0603R  [LED0603-FD]  43.96 50.29 0 top
O9  YLED0603R  [LED0603-FD]  39.9 50.42 0 top
O10  YLED0603R  [LED0603-FD]  35.96 50.42 0 top
O11  YLED0603R  [LED0603-FD]  32.02 50.42 0 top
Q1  BSC0805LS  [PG-TDSON-8_L5.2-W5.9-P1.27-LS6.2-BL-EP]  77.11 22.73 180 top
Q2  BSC0805LS  [PG-TDSON-8_L5.2-W5.9-P1.27-LS6.2-BL-EP]  77.49 47.39 180 top
Q3  BSC0805LS  [PG-TDSON-8_L5.2-W5.9-P1.27-LS6.2-BL-EP]  18.32 22.83 90 top
Q4  BSC0805LS  [PG-TDSON-8_L5.2-W5.9-P1.27-LS6.2-BL-EP]  18.85 45.03 90 top
R8  100Ω  [R0603]  89.55 12.07 0 top
R9  100Ω  [R0603]  90.05 38.72 0 top
R10  100Ω  [R0603]  7.04 10.86 270 top
R11  100Ω  [R0603]  8.69 33.09 270 top
R13  200Ω  [R0603]  28.21 4.7 0 top
R14  220Ω  [RES-ARRAY-SMD_0402-8P-L2.0-W1.0-BL]  75.46 54.23 270 top
RN1  10K  [RES-ARRAY-SMD_0603-8P-L3.2-W1.6-BL]  57.04 30.86 90 top
RN2  220Ω  [RES-ARRAY-SMD_0603-8P-L3.2-W1.6-BL]  48.79 49.78 180 top
RN4  10K  [RES-ARRAY-SMD_0603-8P-L3.2-W1.6-BL]  56.66 25.65 90 top
RN5  330Ω  [RES-ARRAY-SMD_0402-8P-L2.0-W1.0-BL]  24.66 50.8 180 top
RN6  100kΩ  [RES-ARRAY-SMD_0402-8P-L2.0-W1.0-BL]  19.83 50.8 0 top
RS8  20mΩ  [R1206]  88.92 23.24 270 top
RS9  20mΩ  [R1206]  89.42 48.37 270 top
RS10  20mΩ  [R1206]  18.34 10.35 180 top
RS11  20mΩ  [R1206]  18.72 32.33 180 top
RXJ  22-28-4020  [HDR-TH_2P-P2.54-V-M-1]  71.65 49.91 270 top
SW1  TS-1088-AR02016  [SW-SMD_L4.0-W2.9-LS5.0]  3.07 52.58 270 top
U1  MTP125-1108S1  [HDR-TH_8P-P2.54-H-M]  41.55 5.33 0 top
U2  MAX232ESE  [SOIC-16_L9.9-W3.9-P1.27-LS6.0-BL]  49.17 28.07 270 top
U3  78M12  [TO-252-2_L6.6-W6.1-P4.57-LS9.9-TL-CW]  33.75 30.65 0 top
U4  ULN2803  [SOP-18_L11.4-W7.6-P1.27-LS10.6-BL]  65.8 27.81 270 top
U7  MTP125-1108S1  [HDR-TH_8P-P2.54-H-M]  58.69 54.48 0 top

## Footprints (pads in the part's own frame, mm; a bottom-side part is the same pattern mirrored in y, then rotated)
C0603
  rect 0.8x0.9 smd: 1(-0.7,0) 2(0.7,0)
CONN-TH_3P-P3.50_KF250-3.5-3P-1
  round 2 hole 1.3: 1(-3.5,2.5) 2(0,-2.5) 3(3.5,2.5)
CONN-TH_4P-P3.50_KF250-3.5-4P-1
  round 2 hole 1.3: 1(-5.25,2.5) 2(-1.75,-2.5) 3(1.75,2.5) 4(5.25,-2.5)
DSUB-TH_DS1034-01-09FBN044
  rect 1.69x1.69 hole 1.09: 1(5.54,1.42)
  round 1.69 hole 1.09: 2(2.77,1.42) 3(0,1.42) 4(-2.77,1.42) 5(-5.54,1.42) 6(4.155,-1.42) 7(1.385,-1.42) 8(-1.385,-1.42) 9(-4.155,-1.42)
  round 4.826 hole 3.302: 10(12.495,0) 11(-12.495,0)
HDR-TH_2P-P2.54-V-M-1
  rect 1.8x1.8 hole 1: 1(-1.27,0)
  round 1.8 hole 1: 2(1.27,0)
HDR-TH_6P-P2.54-V-M-1
  rect 1.8x1.8 hole 1.2: 1(-6.35,0)
  round 1.8 hole 1.2: 2(-3.81,0) 3(-1.27,0) 4(1.27,0) 5(3.81,0) 6(6.35,0)
HDR-TH_8P-P2.54-H-M
  rect 1.8x1.8 hole 1.2: 1(-8.89,0)
  round 1.8 hole 1.2: 2(-6.35,0) 3(-3.81,0) 4(-1.27,0) 5(1.27,0) 6(3.81,0) 7(6.35,0) 8(8.89,0)
HDR-TH_10P-P2.54-V-M-1
  rect 1.575x1.7 hole 1.1: 1(-11.43,0)
  round 1.7 hole 1.1: 2(-8.89,0) 3(-6.35,0) 4(-3.81,0) 5(-1.27,0) 6(1.27,0) 7(3.81,0) 8(6.35,0) 9(8.89,0) 10(11.43,0)
LED0603-FD
  rect 0.9x1 smd: 1(-0.85,0) 2(0.85,0)
LED-SMD_L1.6-W0.8_19-219-GHC-YR2T1B5Y-3T
  rect 0.8x0.8 smd: 1(0.799,0) 2(-0.799,0)
PG-TDSON-8_L5.2-W5.9-P1.27-LS6.2-BL-EP
  rect 0.7x0.925 smd: 1(-1.905,-2.865) 2(-0.635,-2.865) 3(0.635,-2.865) 4(1.905,-2.865) 5(1.905,2.865) 6(0.635,2.865) 7(-0.635,2.865) 8(-1.905,2.865)
  rect 4.5x4 smd: 9(0.001,0.705)
R0603
  rect 0.806x0.864 smd: 1(-0.753,0) 2(0.753,0)
R1206
  rect 1.208x1.701 smd: 1(-1.479,0) 2(1.479,0)
RES-ARRAY-SMD_0402-8P-L2.0-W1.0-BL
  rect 0.3x0.505 smd: 1(-0.75,0.427) 2(-0.25,0.427) 3(0.25,0.427) 4(0.75,0.427) 5(0.75,-0.427) 6(0.25,-0.427) 7(-0.25,-0.427) 8(-0.75,-0.427)
RES-ARRAY-SMD_0603-8P-L3.2-W1.6-BL
  rect 0.65x0.8 smd: 1(-1.2,-0.9) 4(1.2,-0.9) 5(1.2,0.9) 8(-1.2,0.9)
  rect 0.5x0.8 smd: 2(-0.4,-0.9) 3(0.4,-0.9) 6(0.4,0.9) 7(-0.4,0.9)
SMB_L4.6-W3.6-LS5.3-R-RD
  rect 1.8x2.54 smd: 1(2.4,0) 2(-2.4,0)
SMB_L4.6-W3.6-LS5.3-RD
  rect 2.047x2.192 smd: 1(-2.361,0) 2(2.361,0)
SMB_L4.6-W3.7-LS5.4-RD
  rect 2.047x2.192 smd: 1(-2.361,0) 2(2.361,0)
SOD-123FL_L2.6-W1.6-LS3.4-R-FD
  rect 1.3x1.3 smd: 1(1.7,0) 2(-1.7,0)
SOIC-16_L9.9-W3.9-P1.27-LS6.0-BL
  oval 0.602x1.971 smd: 1(-4.445,-2.736) 2(-3.175,-2.736) 3(-1.905,-2.736) 4(-0.635,-2.736) 5(0.635,-2.736) 6(1.905,-2.736) 7(3.175,-2.736) 8(4.445,-2.736) 9(4.445,2.736) 10(3.175,2.736) 11(1.905,2.736) 12(0.635,2.736) 13(-0.635,2.736) 14(-1.905,2.736) 15(-3.175,2.736) 16(-4.445,2.736)
SOP-18_L11.4-W7.6-P1.27-LS10.6-BL
  oval 0.63x1.615 smd: 1(-5.08,-4.957) 2(-3.81,-4.957) 3(-2.54,-4.957) 4(-1.27,-4.957) 5(0,-4.957) 6(1.27,-4.957) 7(2.54,-4.957) 8(3.81,-4.957) 9(5.08,-4.957) 10(5.08,4.957) 11(3.81,4.957) 12(2.54,4.957) 13(1.27,4.957) 14(0,4.957) 15(-1.27,4.957) 16(-2.54,4.957) 17(-3.81,4.957) 18(-5.08,4.957)
SOT-23-5_L3.0-W1.7-P0.95-LS2.8-BL
  rect 0.49x1.157 smd: 1(-0.95,-1.153) 2(0,-1.153) 3(0.95,-1.153)
  rect 0.49x1.175 smd: 4(0.95,1.153) 5(-0.95,1.153)
SW-SMD_L4.0-W2.9-LS5.0
  rect 1.53x1.36 smd: 1(-2.035,0) 2(2.035,0)
TO-252-2_L6.6-W6.1-P4.57-LS9.9-TL-CW
  rect 2.8x1.3 smd: 1(-3.292,2.273) 3(-3.292,-2.273)
  rect 6.5x6 smd: 2(3.292,0)

## Nets
As in the schematic.

Pads without a net: DSUB1 1 4 6 7 8 9 10 11; H1 5 6; H2 1 2 3 4 5 6; U1 1 2 4; U2 7 8 9 10; U4 10; U7 1 2

## Via types
v1: diameter 0.61, hole 0.305, Top Layer to Bottom Layer, 129 vias
v2: diameter 0.899, hole 0.402, Top Layer to Bottom Layer, 4 vias

## Routing (per net, layer and track width the routed paths; a pad name or vN(x,y) marks a point on that pad's centre or on a via; arc(x,y) is an arc through that point)
+5V: length 228.8
  Top Layer w0.254: 49.19,49.59 48.41,49.59 48.39,49.57 ; 49.19,49.59 49.99,49.59 49.99,48.89 ; 49.19,49.59 49.19,48.89 ; v1(84.85,18.59) 83.88,18.59 82.56,17.26 82.56,16.07 C8-1.2 ; U2.16 51.08,33.33 51.08,35.18 50.78,35.18 ; 50.78,35.18 50.38,35.18 ; 50.78,35.18 50.78,37.15 ; INA9.5 86.75,42.47 C9-1.2 84.97,39.93 85.01,39.97 v1(86.04,39.97) ; 29.68,4.7 30.37,4.01 41.49,4.01 42.82,5.33 ; 29.68,4.7 R13.2 ; 29.68,4.7 28.95,3.97 28.95,3.97 28.51,3.54 12.19,3.54 6.22,9.5 6.22,10.6 6.48,10.86 7.56,10.86 7.94,11.25 11.68,11.25 11.68,13.04 11.42,13.3 11.42,16.23 ; v1(46.47,48.99) 46.84,48.99 46.95,48.89 47.59,48.89 47.59,49.59 48.36,49.59 48.39,49.57 ; C8-1.2 85.85,15.3 87.38,16.83 INA8.5 ; C8-1.2 83.33,11.11 79.58,7.36 v1(51.74,7.36) ; C11-1.2 11.93,35.14 12.57,34.5 12.57,33.61 12.34,33.38 v1(11.24,33.38) ; 48.39,49.57 48.39,48.89 ; 11.42,16.23 v1(9.6,16.23) ; 11.42,16.23 11.42,16.96 ; 50.78,37.15 v1(49.55,37.15) ; 50.78,37.15 v1(52.67,37.15)
  Bottom Layer w0.254: v1(11.24,33.38) 9.6,31.74 v1(9.6,16.23) ; v1(49.55,37.15) 46.47,40.23 v1(46.47,48.99) ; 42.82,5.33 44.45,3.7 50.68,3.7 51.74,4.76 v1(51.74,7.36) 51.74,14.34 52.9,15.49 52.9,26.93 52.67,27.16 52.67,37.14 v1(52.67,37.15) ; v1(86.04,39.97) 84.85,38.78 v1(84.85,18.59)
GND: length 333.1
  Top Layer w0.254: 42.27,21.24 42.27,24.28 43.07,25.09 ; 42.27,21.24 CN7.2 ; 42.27,21.24 48.92,21.24 48.96,21.2 ; RS8.2 88.92,21.07 ; 88.92,21.07 87.51,22.49 v1(86.19,22.49) 82.56,22.49 80.54,24.51 74.14,24.51 71.72,22.09 61.49,22.09 U4.9 60.85,22.22 59.82,21.2 48.96,21.2 ; 88.92,21.07 88.92,20.85 88.56,20.5 88.56,19.25 88.66,19.15 89.11,19.15 89.17,19.09 89.17,18.73 ; SW1.1 4.06,54.61 9.73,48.93 23.57,48.93 23.98,48.52 34.13,48.52 v1(34.85,49.24) 36.44,49.24 36.81,49.61 ; v1(87.68,43.18) 88.02,43.52 90.09,43.52 ; 90.09,43.52 90.19,43.42 INA9.2 ; 90.09,43.52 89.91,43.71 89.91,45.49 89.42,45.98 RS9.2 ; O11.2 33.63,50.42 33.63,50.63 v1(33.99,50.99) ; 14.47,32.33 13.66,32.33 13.52,32.19 13.52,31.3 ; 14.47,32.33 v1(15.95,32.33) 17.24,32.33 ; 14.47,32.33 14.47,34.5 14.17,34.5 14.12,34.46 14.12,34.23 13.94,34.06 13.92,34.06 13.33,34.66 13.33,38.68 ; 36.81,49.61 O10.2 ; 36.81,49.61 39.99,49.61 ; 19.08,50.37 20.58,50.37 20.65,50.31 v1(21.68,50.31) ; C8-1.1 83.33,17.41 89.32,17.41 89.69,17.78 ; 13.53,16.96 13.69,17.12 v1(14.04,17.12) ; 13.53,16.96 12.82,16.96 ; 13.53,16.96 13.53,13.09 13.58,13.04 13.58,11.25 13.05,10.72 12.63,10.72 12.63,8.95 12.72,8.85 14.44,8.85 15.95,10.36 ; 16.86,10.36 15.95,10.36 ; 15.95,10.36 21.48,4.83 5VLED.2 24.19,4.83 24.19,5.4 25.75,6.96 43.73,6.96 45.36,5.33 U1.7 ; O9.2 39.99,50.42 39.99,49.61 ; 39.99,49.61 40.19,49.41 43.74,49.41 44.05,49.72 44.05,50.29 O8.2 ; 48.96,21.2 48.96,16.03 ; 89.69,17.78 89.69,18.21 89.17,18.73 ; 89.69,17.78 90.58,17.78 ; 37.04,30.66 40.6,30.66 41.92,29.34 v1(47.73,29.34) 49.63,31.24 U2.15 ; 89.17,18.73 INA8.4
  Bottom Layer w0.254: v1(14.04,17.12) 15.95,19.03 v1(15.95,32.33) 21.68,38.05 v1(21.68,50.31) 21.66,50.31 ; U1.7 47.9,14.96 48.96,16.03 47.73,17.26 v1(47.73,29.34) 38.45,38.61 38.45,45.64 v1(34.85,49.24) 34.85,50.13 v1(33.99,50.99) ; v1(86.19,22.49) 87.68,23.97 v1(87.68,43.18)
  vias: v1(5.44,56.24) v1(5.44,51.16) v1(5.44,15.6) v1(5.44,5.44) v1(10.52,56.24) v1(10.52,51.16) v1(10.52,35.92) v1(10.52,30.84) v1(15.6,56.24) v1(15.6,51.16) v1(15.6,35.92) v1(15.6,5.44) v1(20.68,25.76) v1(20.68,5.44) v1(25.76,56.24) v1(25.76,41) v1(25.76,35.92) v1(25.76,25.76) v1(25.76,20.68) v1(25.76,15.6) v1(25.76,10.52) v1(30.84,56.24) v1(30.84,46.08) v1(30.84,41) v1(30.84,35.92) v1(30.84,15.6) v1(30.84,10.52) v1(35.92,56.24) v1(35.92,35.92) v1(35.92,20.68) v1(41,46.08) v1(41,41) v1(41,35.92) v1(41,30.84) v1(41,20.68) v1(46.08,51.16) v1(46.08,20.68) v1(46.08,15.6) v1(51.16,20.68) v1(56.24,35.92) v1(56.24,20.68) v1(61.32,46.08) v1(61.32,20.68) v1(66.4,46.08) v1(66.4,20.68) v1(71.48,20.68) v1(71.48,15.6) v1(71.48,5.44) v1(76.56,35.92) v1(76.56,5.44) v1(81.64,56.24) v1(81.64,35.92) v1(81.64,30.84) v1(81.64,15.6) v1(81.64,5.44) v1(86.72,56.24) v1(86.72,46.08) v1(86.72,35.92) v1(86.72,30.84) v1(86.72,20.68) v1(86.72,5.44) v1(91.8,56.24) v1(91.8,51.16) v1(91.8,41) v1(91.8,35.92) v1(91.8,30.84) v1(91.8,25.76) v1(91.8,20.68) v1(91.8,15.6) v1(91.8,10.52) v1(91.8,5.44)
TH1: length 36.2
  Top Layer w1.001: 15.91,46.86 15.63,47.13 D11-2.2 ; 15.91,46.86 15.98,46.93 15.98,48.05 23.23,48.05 26.62,44.66 CN6.1 ; 15.91,46.86 15.98,46.78 15.98,45.66 17.51,45.66 18.14,45.03 17.51,44.39 15.98,44.39 15.98,42 16.45,41.54 D11-3.2
TH2: length 22.5
  Top Layer w1.001: 19.52,32.33 18.83,32.33 18.83,31.3 18.24,30.71 15.05,30.71 14.47,31.3 ; 19.52,32.33 19.52,38.1 19.58,38.17 21.25,38.17 21.25,40.21 21.71,40.67 Q4.2 21.71,45.66 ; 19.52,32.33 RS11.1
TH3: length 48.1
  Top Layer w1.001: D10-3.2 15.94,19.32 15.46,19.81 15.46,22.19 16.98,22.19 17.62,22.83 16.99,23.46 15.46,23.46 15.46,24.58 15.1,24.94 ; 15.46,25.29 15.1,24.94 ; 15.46,25.29 15.46,25.85 17.2,25.85 22.27,30.92 31.76,30.92 32.83,31.98 32.83,36 CN6.2 ; 15.46,25.29 15.46,24.73 ; 15.1,24.94 14.88,25.16 D10-2.2
TH4: length 20.9
  Top Layer w1.001: 19.82,11.97 15.6,11.97 13.58,9.95 13.58,9.84 ; 19.82,11.97 19.82,10.36 ; 19.82,11.97 20.74,12.9 20.74,17.09 21.19,17.54 21.19,23.46
TH5: length 54.9
  Top Layer w1.001: CN6.3 42.76,41.9 71.43,41.9 73.22,40.11 D9-2.2 76.8,40.11 76.8,43.24 76.85,43.29 76.85,44.52 ; D9-3.2 82.43,45.72 81.23,44.52 Q2.7 76.85,44.52 ; 76.85,44.52 76.85,46.05 77.49,46.69 ; 76.85,44.52 Q2.5
TH6: length 19.7
  Top Layer w1.001: 76.85,50.25 Q2.2 80.51,50.25 80.77,50.52 D9-3.1 87.13,50.52 87.8,49.85 RS9.1 89.42,48.48 90.45,48.48 91.08,47.85 91.08,44.37
TH7: length 69.8
  Top Layer w1.001: 81.21,20.95 81.8,20.35 83.97,20.35 ; 81.21,20.95 80.13,19.87 Q1.8 Q1.7 Q1.6 Q1.5 74.08,19.87 71.59,17.37 ; 81.21,20.95 80.12,22.03 77.11,22.03 ; 71.59,17.37 71.09,17.86 50.91,17.86 v2(50.16,17.11) ; 71.59,17.37 73.07,15.89 74.86,15.89
  Bottom Layer w1.001: CN6.4 49.84,33.32 49.84,17.44 v2(50.16,17.11)
TH8: length 20.1
  Top Layer w1.001: 90.58,18.73 90.58,22.72 89.95,23.35 88.92,23.35 RS8.1 86.43,24.72 86,25.15 81.93,25.15 81.48,25.6 Q1.1 Q1.2 Q1.3
TH9: length 5.8
  Top Layer w1.001: 79.59,15.89 79.59,14.02 79.6,14 79.6,10.04
TH10: length 6.5
  Top Layer w1.001: 79.73,40.11 79.73,36.02 80.1,35.65 80.1,33.78
TH11: length 6
  Top Layer w1.001: D10-2.1 9.75,20.44 9.62,20.31 5.64,20.31
TH12: length 5.8
  Top Layer w1.001: D11-1.1 8.14,42.54 8.27,42.41 D11-2.1
THICK-LOAD+V: length 132.4
  Top Layer w1.001: 5.64,29.03 5.64,25.03 ; 5.64,29.03 4.41,30.26 4.41,44.05 5.83,45.47 6.28,45.47 D11-1.2 ; 5.64,29.03 v2(18.58,29.03) ; D9-1.2 73.59,33.78 73.59,33.96 v2(73.55,34) ; v2(77.13,10.24) 76.87,10.24 76.67,10.04 D8-1.2 34.28,10.04 CN7.3
  Bottom Layer w1.001: v2(73.55,34) 77.13,30.42 v2(77.13,10.24) ; CN7.3 18.58,25.74 v2(18.58,29.03)
$1N5: length 4.2
  Top Layer w0.254: D1.1 27.27,32.81 27.38,32.93 30.46,32.93
$1N6: length 46
  Top Layer w0.254: U2.11 53.78,26.16 v1(54.66,25.29)
  Bottom Layer w0.254: 54.11,25.83 v1(54.66,25.29) 54.66,26.53 53.49,27.7 53.49,30.32 54.11,30.94 54.11,37.28 57.43,40.6 57.43,50.97 56.21,52.18 56.21,55.08 56.9,55.77 63.76,55.77 U7.7
$1N7: length 3.6
  Top Layer w0.254: 46.43,29.97 44.4,29.97 43.83,30.54 C1.1
$1N8: length 3.4
  Top Layer w0.254: 46.43,27.43 44.4,27.43 43.96,26.99 C2.1
$1N10: length 4.4
  Top Layer w0.254: 46.43,26.16 45.55,26.16 43.07,23.68
$1N11: length 15.6
  Top Layer w0.254: U2.13 51.98,28.62 v1(54.12,28.62)
  Bottom Layer w0.254: v1(54.12,28.62) 55.27,27.48 55.27,16.79 54.5,16.03
$1N12: length 17.4
  Top Layer w0.254: U2.14 51.97,29.91 v1(54.12,29.91) 54.12,29.9
  Bottom Layer w0.254: v1(54.12,29.91) 54.12,29.6 57.27,26.45 57.27,16.03
$1N13: length 3.4
  Top Layer w0.254: C2.2 43.96,28.39 44.27,28.7 46.43,28.7
$1N14: length 5.2
  Top Layer w0.254: 48.98,35.18 48.98,33.37 46.85,31.24 46.43,31.24
$1N19: length 77.9
  Top Layer w0.254: 3.07,50.54 4.06,50.54 4.06,50.21 v1(4.77,49.49) ; v1(10.49,7.4) 13.95,3.95 28.15,3.95 28.21,4.01 28.21,5.37 29.39,6.55 36.52,6.55 37.74,5.33
  Bottom Layer w0.254: v1(10.49,7.4) 8.98,8.91 8.98,45.28 v1(4.77,49.49)
$1N20: length 38.9
  Top Layer w0.254: 30.46,28.38 32.17,28.38 35.33,25.22 v1(40.56,25.22)
  Bottom Layer w0.254: 50.44,5.33 49.23,4.13 47.33,4.13 46.69,4.77 46.69,19.1 v1(40.56,25.22)
$1N21: length 3.6
  Top Layer w0.254: 46.43,32.51 44.4,32.51 43.83,31.94 C1.2
$1N25: length 17.4
  Top Layer w0.254: v1(28.01,28.22) 27.27,28.96 27.27,29.42 26.31,29.42
  Bottom Layer w0.254: CN7.1 35.08,21.15 v1(28.01,28.22)
$1N26: length 26.7
  Top Layer w0.254: 70.76,32.89 69.42,34.23 v1(67.15,34.23)
  Bottom Layer w0.254: v1(67.15,34.23) 64.79,36.59 64.79,42.9 65.28,43.38 65.28,46.2 64.86,46.61 64.86,52.12 U7.6
$1N27: length 34.6
  Top Layer w0.254: v1(58.41,53.41) 59.48,54.48 U7.5 ; U4.16 64.86,30.35 v1(63.59,31.62)
  Bottom Layer w0.254: v1(58.41,53.41) 60.23,51.6 60.76,51.6 61.12,51.24 61.12,48.8 64.45,45.47 64.45,43.72 63.59,42.86 v1(63.59,31.62)
$1N28: length 39.1
  Top Layer w0.254: U4.14 63.46,27.81 v1(62.45,28.83)
  Bottom Layer w0.254: v1(62.45,28.83) 64.21,30.59 64.21,42.89 64.86,43.55 64.86,46.03 64.45,46.44 64.45,48.49 60.93,52.01 60.68,52.01 58.21,54.48 U7.4
$1N29: length 48.1
  Top Layer w0.254: U7.3 56.2,55.8 69.05,55.8 v1(70.82,54.04) ; v1(71.89,25.91) 71.26,25.27 70.76,25.27
  Bottom Layer w0.254: v1(70.82,54.04) 71.07,54.04 72.88,52.23 72.88,37.42 71.89,36.43 v1(71.89,25.91)
$1N30: length 23.7
  Top Layer w0.254: v1(68.19,33.42) 69.99,31.62 U4.17 ; v1(65.62,51.62) 65.38,51.38 65.26,51.38 65.26,50.67
  Bottom Layer w0.254: v1(68.19,33.42) 68.19,49.05 v1(65.62,51.62)
$1N31: length 32.8
  Top Layer w0.254: U4.15 63.56,29.08 v1(62.44,30.2) ; v1(60.51,50.99) 60.74,50.75 60.74,50.67 61.45,50.67
  Bottom Layer w0.254: v1(60.51,50.99) 60.51,48.8 64.04,45.26 64.04,44.09 62.44,42.49 v1(62.44,30.2)
$1N32: length 59.7
  Top Layer w0.254: I4.2 57.06,50.67 56.35,51.38 52.59,51.38 v1(52.42,51.21) ; U4.13 62.6,26.54 v1(61.95,27.2) ; v1(59.7,21.94) 59.41,21.64 51.59,21.64 v1(50.91,22.33)
  Bottom Layer w0.254: v1(61.95,27.2) 61.95,24.18 v1(59.7,21.94) ; v1(52.42,51.21) 50.91,49.7 v1(50.91,22.33)
$1N33: length 49.1
  Top Layer w0.254: v1(54.62,22.33) 55.67,23.37 70.13,23.37 U4.11 ; v1(54.86,49.88) 54.78,49.96 54.08,49.96 54.08,50.67
  Bottom Layer w0.254: v1(54.86,49.88) 57.02,47.72 57.02,40.93 53.68,37.59 53.68,31.09 53.08,30.49 53.08,27.33 53.49,26.91 53.49,23.46 v1(54.62,22.33)
$1N49: length 21.8
  Top Layer w0.254: 56.14,30.46 56.85,30.46 56.85,29.66 55.43,29.66 55.24,29.85 v1(54.96,29.85)
  Bottom Layer w0.254: 62.6,44.79 62.22,44.79 54.96,37.53 v1(54.96,29.85)
$1N50: length 16.2
  Top Layer w0.254: RN4.5 56.45,26.85 ; 56.45,26.85 56.47,26.85 56.47,26.06 55.76,26.06 ; 56.45,26.85 56.45,27.24 v1(56.92,27.71)
  Bottom Layer w0.254: v1(56.92,27.71) 56.92,37.62 59.1,39.79
$1N51: length 31.2
  Top Layer w0.254: v1(51.97,22.33) 53.76,22.33 55.25,23.82 55.76,23.82 RN4.8 56.47,24.46 56.47,25.26 RN4.7
  Bottom Layer w0.254: 55.6,44.79 51.97,41.16 v1(51.97,22.33)
$1N52: length 3.5
  Top Layer w0.254: U4.8 60.39,24.46 57.56,24.46
$1N53: length 3.3
  Top Layer w0.254: 57.56,25.26 60.83,25.26 60.85,25.27
$1N54: length 3.5
  Top Layer w0.254: U4.6 60.36,26.06 57.56,26.06
$1N55: length 4.1
  Top Layer w0.254: 57.56,26.85 57.56,27.49 60.52,27.49 U4.5
$1N56: length 36.3
  Top Layer w0.254: U2.12 53.81,27.43 54.79,28.41 59.33,28.41 v1(59.47,28.27)
  Bottom Layer w0.254: RXJ.2 71.39,48.38 71.39,35.66 63.78,28.05 59.7,28.05 v1(59.47,28.27)
$1N57: length 5.7
  Bottom Layer w0.254: RXJ.1 70.44,51.18 70.44,51.63 U7.8
$1N596: length 2.4
  Top Layer w0.254: 27.46,4.7 26.01,4.7 25.88,4.83 25.13,4.83
$1N599: length 3.6
  Top Layer w0.254: 57.94,32.06 57.94,32.7 60.65,32.7 60.85,32.89
$1N600: length 3.1
  Top Layer w0.254: RN1.3 60.48,31.26 U4.2
$1N601: length 2.9
  Top Layer w0.254: 57.94,30.46 60.74,30.46 U4.3
$1N602: length 3.1
  Top Layer w0.254: U4.4 59.23,29.08 58.65,29.66 57.94,29.66
$1N2481: length 19.1
  Top Layer w0.254: 25.41,50.37 26.15,51.12 26.93,51.12 27.82,52.01 40.63,52.01 42.35,50.29 O8.1
$1N2485: length 15.9
  Top Layer w0.254: 24.91,50.37 24.91,49.81 25.76,49.81 26.66,50.71 27.1,50.71 27.99,51.6 37.1,51.6 38.29,50.42 O9.1
$1N2489: length 12.2
  Top Layer w0.254: 24.41,50.37 24.41,49.6 24.66,49.34 26.3,49.34 26.71,49.75 28.72,49.75 28.91,49.57 33.51,49.57 34.35,50.42 O10.1
$1N2499: length 10
  Top Layer w0.254: v1(28.47,49.14) 28.26,48.93 24.36,48.93 23.91,49.39 23.91,50.37 ; v1(28.32,50.37) 28.37,50.42 31.17,50.42
  Bottom Layer w0.254: v1(28.32,50.37) 28.47,50.22 v1(28.47,49.14)
$1N4108: length 16
  Top Layer w0.254: 66.1,39.79 62.74,39.79 56.14,33.19 56.14,32.06 56.85,32.06 56.85,31.26 56.14,31.26
$1N8074: length 18.5
  Top Layer w0.254: 49.99,50.68 50.62,50.68 52.35,48.95 64.82,48.95 66.15,50.28 66.15,50.67 I2.1
$1N8085: length 15.5
  Top Layer w0.254: 49.19,50.68 49.19,51.39 49.62,51.83 57.39,51.83 57.65,51.57 60.22,51.57 60.25,51.6 61.77,51.6 62.34,51.03 62.34,50.67 I3.1
$1N8105: length 23.2
  Top Layer w0.254: 48.39,50.68 48.39,51.39 49.23,52.24 57.56,52.24 57.82,51.98 60.05,51.98 60.08,52.01 63.04,52.01 63.77,51.28 63.77,50.16 63.57,49.96 59.37,49.96 I4.1
$1N8110: length 29.1
  Top Layer w0.254: I5.1 56.39,50.67 57.57,49.49 63.76,49.49 64.25,49.99 64.25,51.38 63.21,52.42 59.91,52.42 59.88,52.39 57.99,52.39 57.73,52.65 48.84,52.65 47.59,51.39 47.59,50.68
$1N10348: length 37
  Top Layer w0.254: R8.1 88.09,12.07 82.96,6.94 57.34,6.94 56.22,5.81 56.22,5.21 55.01,5.21
$1N10353: length 5.9
  Top Layer w0.254: R8.2 90.31,12.81 89.69,13.42 89.69,16.83 90.58,16.83
$1N10722: length 4.9
  Top Layer w0.254: R9.2 90.81,39.46 90.19,40.08 90.19,42.47 INA9.1
$1N10973: length 5.8
  Top Layer w0.254: 11.68,9.84 11.68,10.72 8.39,10.72 7.78,10.11 R10.2
$1N11224: length 4.8
  Top Layer w0.254: 12.57,31.3 12.57,32.19 12.42,32.33 8.69,32.33
$1N16140: length 5.9
  Top Layer w0.254: 88.77,44.37 87.88,44.37 84.97,41.46 84.97,41.33 C9-1.1
$1N19766: length 87.6
  Top Layer w0.254: 62.63,5.21 60.14,2.72 11.11,2.72 v1(10.82,3.01) ; 8.69,33.84 7.95,33.84 7.57,34.21 v1(7.03,34.21)
  Bottom Layer w0.254: v1(10.82,3.01) 7.03,6.8 v1(7.03,34.21)
$1N19775: length 61.1
  Top Layer w0.254: 60.09,5.21 58.01,3.13 11.94,3.13 5.68,9.39 5.68,11 6.3,11.62 R10.1
$1N19778: length 65.4
  Top Layer w0.254: v1(59.88,36.06) 74.05,36.06 78.15,40.16 78.15,41.17 78.54,41.56 81.23,41.56 84.08,38.72 R9.1
  Bottom Layer w0.254: 57.55,5.21 57.41,5.35 57.41,14.24 58.8,15.63 58.8,34.98 v1(59.88,36.06)
$1N19892: length 95.8
  Top Layer w0.254: 23.27,58.06 75.8,58.06 78.01,55.85 78.01,55.18 77.31,54.48 R14.2 ; v1(22.79,25.27) 22.26,24.73 21.19,24.73
  Bottom Layer w0.254: v1(23.27,58.06) 21,55.79 21,52.09 22.79,50.3 v1(22.79,25.27) 22.26,24.73
$1N19926: length 70.3
  Top Layer w0.254: 23.91,51.23 22.37,49.69 18.86,49.69 18.61,49.95 18.61,50.75 19.08,51.23 19.08,52.76 21.96,55.64 23.79,55.64 24.22,55.22 24.22,54.03 24.93,53.32 36.95,53.32 H2.7 40.7,57.07 72.38,57.07 74.47,54.98 R14.8
$1N19936: length 59.9
  Top Layer w0.254: 25.04,52.19 24.91,52.05 24.91,51.23 ; 25.04,52.19 25.73,52.88 41.59,52.88 H2.9 44.93,56.21 69.51,56.21 71.74,53.98 75.03,53.98 ; 25.04,52.19 24.4,52.83 22,52.83 21.87,52.7 20.85,52.7 20.08,51.93 20.08,51.23
$1N19946: length 61.3
  Top Layer w0.254: 24.41,51.23 24.41,51.79 24.1,52.09 v1(24.1,52.18) ; R14.7 72.54,54.48 70.4,56.62 42.8,56.62 H2.8 ; 19.58,51.23 19.58,52.14 20.75,53.31 v1(21.62,53.31) 21.62,53.32
  Bottom Layer w0.254: H2.8 38.52,52.35 24.27,52.35 v1(24.1,52.18) 22.97,53.31 v1(21.62,53.31) ; v1(21.62,53.31) 21.62,53.32 ; v1(21.62,53.31) 21.41,53.31
$1N19956: length 60.4
  Top Layer w0.254: 45.74,53.14 H2.10 ; 45.74,53.14 57.81,53.14 58.16,52.8 59.71,52.8 59.74,52.83 73.82,52.83 74.47,53.48 75.03,53.48 ; 45.74,53.14 45.02,52.42 27.22,52.42 26.6,51.81 ; 26.6,51.81 v1(26.67,51.73) 26.45,51.73 ; 26.6,51.81 25.43,51.81 25.41,51.79 25.41,51.23 ; 23.12,51.75 v1(22.88,51.75) 22.84,51.79 20.58,51.79 20.58,51.23
  Bottom Layer w0.254: 26.45,51.73 v1(26.67,51.73) 26.45,51.51 23.12,51.51 v1(22.88,51.75) 23.12,51.75
$1N20048: length 32.2
  Top Layer w0.254: v1(73.58,25.67) 74.47,25.67 74.54,25.6 Q1.4 ; v1(74.72,51.02) 74.72,52.31 75.88,53.48
  Bottom Layer w0.254: 74.72,51.98 v1(74.72,51.02) 74.72,38.53 72.62,36.43 72.62,26.63 v1(73.58,25.67)
$1N20053: length 4.6
  Top Layer w0.254: 75.88,53.98 76.45,53.98 76.45,52.95 75.58,52.08 Q2.4
$1N20058: length 64.3
  Top Layer w0.254: R14.1 76.45,54.98 76.88,55.41 v1(77.25,55.41) ; v1(73.7,51.13) 73.7,50.85 72.76,49.91 70.38,49.91 68.28,47.8 38.42,47.8 33.74,43.12 26.69,43.12 22.87,46.93 21.71,46.93
  Bottom Layer w0.254: v1(73.7,51.13) 73.7,51.86 v1(77.25,55.41)

## Copper pours and planes (outline as drawn; the poured copper is in the pictures)
GND on Top Layer: 0,59.44 93.22,59.44 93.22,0 0,0
GND on Bottom Layer: 0,59.44 93.22,59.44 93.22,0 0,0

## Text on the board
Bottom Silkscreen Layer: 7 | 6~ | 5~ | A0 | A1 | 4 | 3~ | A2 | 2 | A3 | 1(TX OUT) | A4 | 0(RX IN) | A5 | AD5/SCL | AD4/SDA | AREF | GND | 13 | 12 | 11~ | 10~ | 9~ | 8
Top Silkscreen Layer: v5 | 11 | 10 | 9 | 8 | 5 | 4 | 3 | 2 | output | input | VL+ | gnd | 24v
